# Altium project FMM-v1.0.PrjPcb (part 6 of 6)
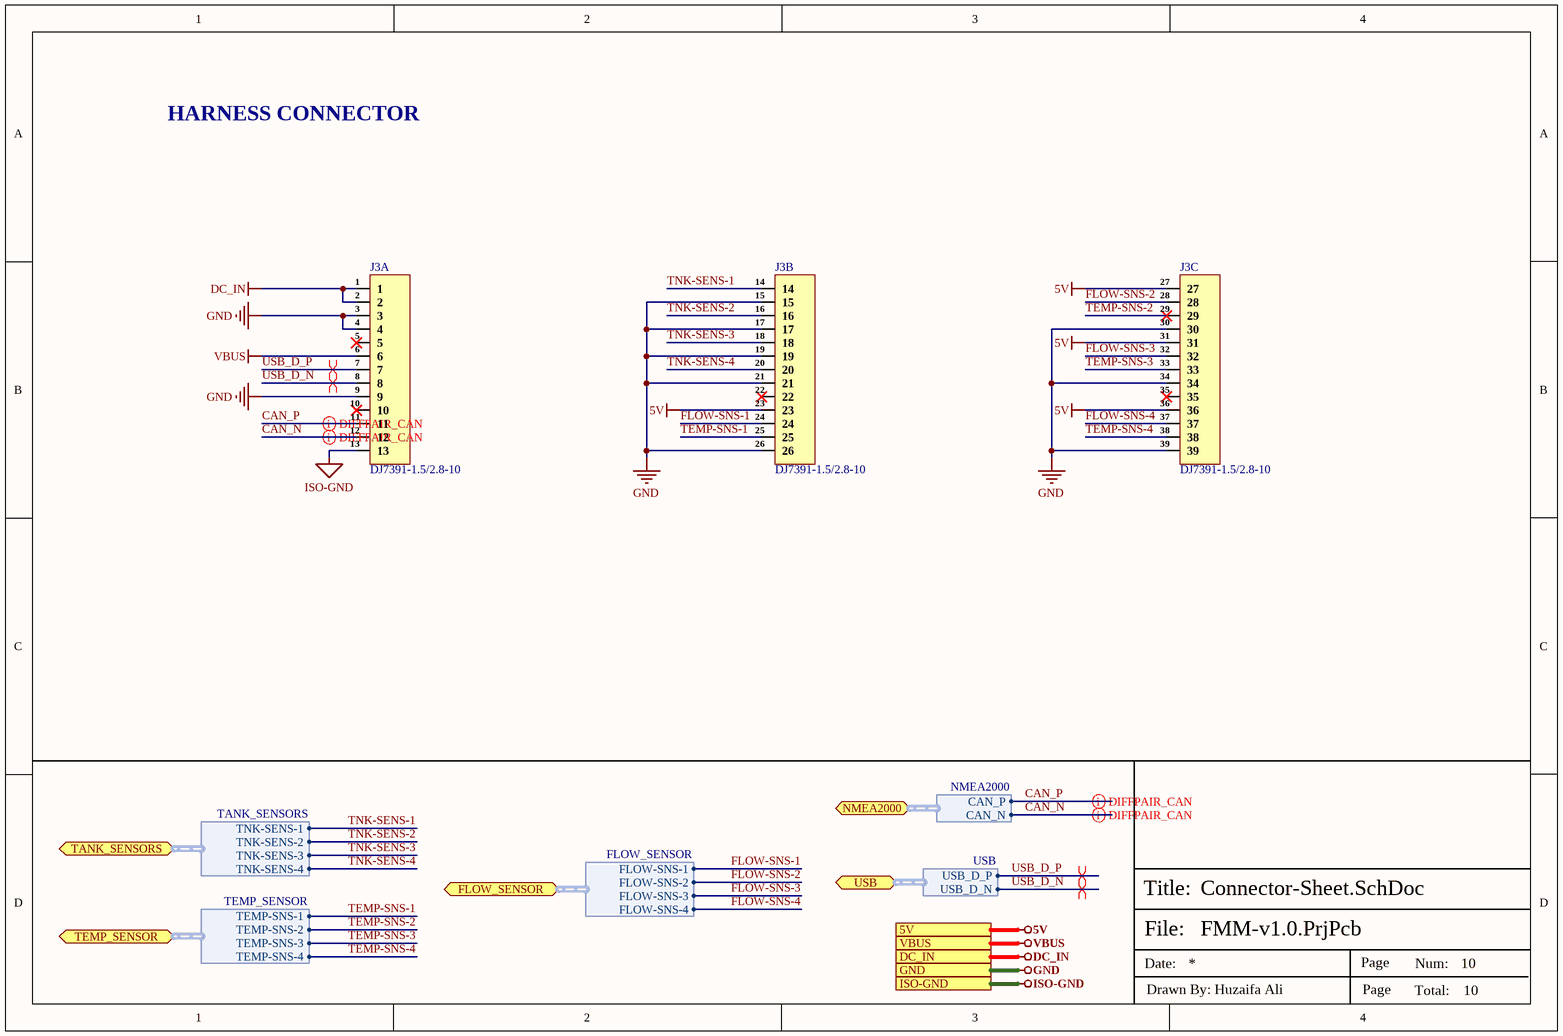
[diagram p12: Connector-Sheet.SchDoc]

## Nets that join several sheets
3V3: Power-Sheet-2 (8 pins), USB-to-UART-Sheet (7 pins), Controller-Sheet (6 pins), Storage-Sheet (C38.2 C39.2 R27.2 U8.8), CAN-Transceiver-Sheet (C46.2 C47.1 C48.2 U9.1), Tank-Level-Sensor-Sheet (C54.1 FB2.2), Fuel-Sensor-Sheet (26 pins)
5V: Power-Sheet-1 (6 pins), Power-Sheet-2 (C24.1 U3.5 U3.8), USB-to-UART-Sheet (D7.2), Connector-Sheet (J3.23 J3.27 J3.31 J3.36)
5V-ISO: Power-Sheet-2 (C28.2 C29.2 U5.5), CAN-Transceiver-Sheet (C43.2 C44.1 C45.2 U9.16)
12V: Power-Sheet-1 (16 pins), Tank-Level-Sensor-Sheet (8 pins)
DC_IN: Power-Sheet-1 (F1.1), Connector-Sheet (J3.1 J3.2)
GND: Power-Sheet-1 (39 pins), Power-Sheet-2 (12 pins), USB-to-UART-Sheet (8 pins), Controller-Sheet (14 pins), Storage-Sheet (C38.1 C39.1 U8.4), CAN-Transceiver-Sheet (7 pins), Tank-Level-Sensor-Sheet (10 pins), Fuel-Sensor-Sheet (32 pins), Connector-Sheet (11 pins)
ISO-GND: Power-Sheet-2 (6 pins), CAN-Transceiver-Sheet (10 pins), Connector-Sheet (J3.13)
VBUS: USB-to-UART-Sheet (D7.1 D8.2 R16.1), Connector-Sheet (J3.6)
ACT-LED: Controller-Sheet (U7.31), CAN-Transceiver-Sheet (R28.2)
ADC: Power-Sheet-1 (D3.2 R4.1 R6.2), Controller-Sheet (U7.7)
CAN_N: CAN-Transceiver-Sheet (C42.1 D11.1 L3.3 R32.1), Connector-Sheet (J3.12)
CAN_P: CAN-Transceiver-Sheet (C40.2 D11.2 L3.4 R29.2), Connector-Sheet (J3.11)
CS: Controller-Sheet (U7.23), Storage-Sheet (R27.1 U8.2)
EN: USB-to-UART-Sheet (Q3.3), Controller-Sheet (6 pins)
FLOW-RDN-1: Controller-Sheet (U7.10), Fuel-Sensor-Sheet (U15.2)
FLOW-RDN-2: Controller-Sheet (U7.11), Fuel-Sensor-Sheet (U15.4)
FLOW-RDN-3: Controller-Sheet (U7.12), Fuel-Sensor-Sheet (U15.6)
FLOW-RDN-4: Controller-Sheet (U7.30), Fuel-Sensor-Sheet (U15.8)
FLOW-SNS-1: Fuel-Sensor-Sheet (R38.1 U15.1), Connector-Sheet (J3.24)
FLOW-SNS-2: Fuel-Sensor-Sheet (R39.1 U15.3), Connector-Sheet (J3.28)
FLOW-SNS-3: Fuel-Sensor-Sheet (R40.1 U15.5), Connector-Sheet (J3.32)
FLOW-SNS-4: Fuel-Sensor-Sheet (R41.1 U15.9), Connector-Sheet (J3.37)
IO0: USB-to-UART-Sheet (Q4.3), Controller-Sheet (J2.5 SW1.1 U7.25)
IO32: Controller-Sheet (U7.8), Fuel-Sensor-Sheet (R48.1 U18.2)
IO33: Controller-Sheet (U7.9), Tank-Level-Sensor-Sheet (R36.1 U13.2)
MISO: Controller-Sheet (U7.14), Storage-Sheet (U8.6)
MOSI: Controller-Sheet (U7.16), Storage-Sheet (U8.5)
RXD: USB-to-UART-Sheet (U6.25), Controller-Sheet (J2.3 U7.35)
RXD0: USB-to-UART-Sheet (U6.26), Controller-Sheet (J2.4 U7.34)
RXD-CAN: Controller-Sheet (U7.27), CAN-Transceiver-Sheet (R30.1)
SCL: Controller-Sheet (R25.2 U7.36), Tank-Level-Sensor-Sheet (U13.10), Fuel-Sensor-Sheet (U18.10)
SCLK: Controller-Sheet (U7.13), Storage-Sheet (U8.3)
SDA: Controller-Sheet (R26.2 U7.33), Tank-Level-Sensor-Sheet (U13.9), Fuel-Sensor-Sheet (U18.9)
TEMP-SNS-1: Fuel-Sensor-Sheet (R42.1 R46.1), Connector-Sheet (J3.25)
TEMP-SNS-2: Fuel-Sensor-Sheet (R49.1 R53.1), Connector-Sheet (J3.29)
TEMP-SNS-3: Fuel-Sensor-Sheet (R55.1 R59.1), Connector-Sheet (J3.33)
TEMP-SNS-4: Fuel-Sensor-Sheet (R61.1 R65.1), Connector-Sheet (J3.38)
TNK-SENS-1: Tank-Level-Sensor-Sheet (D12.2 R33.2 U10.1 U13.4), Connector-Sheet (J3.14)
TNK-SENS-2: Tank-Level-Sensor-Sheet (D14.2 R35.2 U12.1 U13.5), Connector-Sheet (J3.16)
TNK-SENS-3: Tank-Level-Sensor-Sheet (D15.2 R37.2 U13.6 U14.1), Connector-Sheet (J3.18)
TNK-SENS-4: Tank-Level-Sensor-Sheet (D13.2 R34.2 U11.1 U13.7), Connector-Sheet (J3.20)
TXD-CAN: Controller-Sheet (U7.28), CAN-Transceiver-Sheet (R31.1)
USB_D_N: USB-to-UART-Sheet (D10.2 U6.5), Connector-Sheet (J3.8)
USB_D_P: USB-to-UART-Sheet (D9.2 U6.4), Connector-Sheet (J3.7)